# Altium schematic sheet SPSU_0.SchDoc: SPSU
size 292 x 208 mm; PCB_VERSION: V3.0; Origin: Eagle; Date: 12/02/2024 2:33:38 pm; SheetNumber: 1; SCHEMATIC_VERSION: V3.0; GateName_1: G$1; SymbolName_1: A4L-LOC; LibraryName: frames_corvus; DeviceSetName: A4L-LOC; Sheet: Sheet:
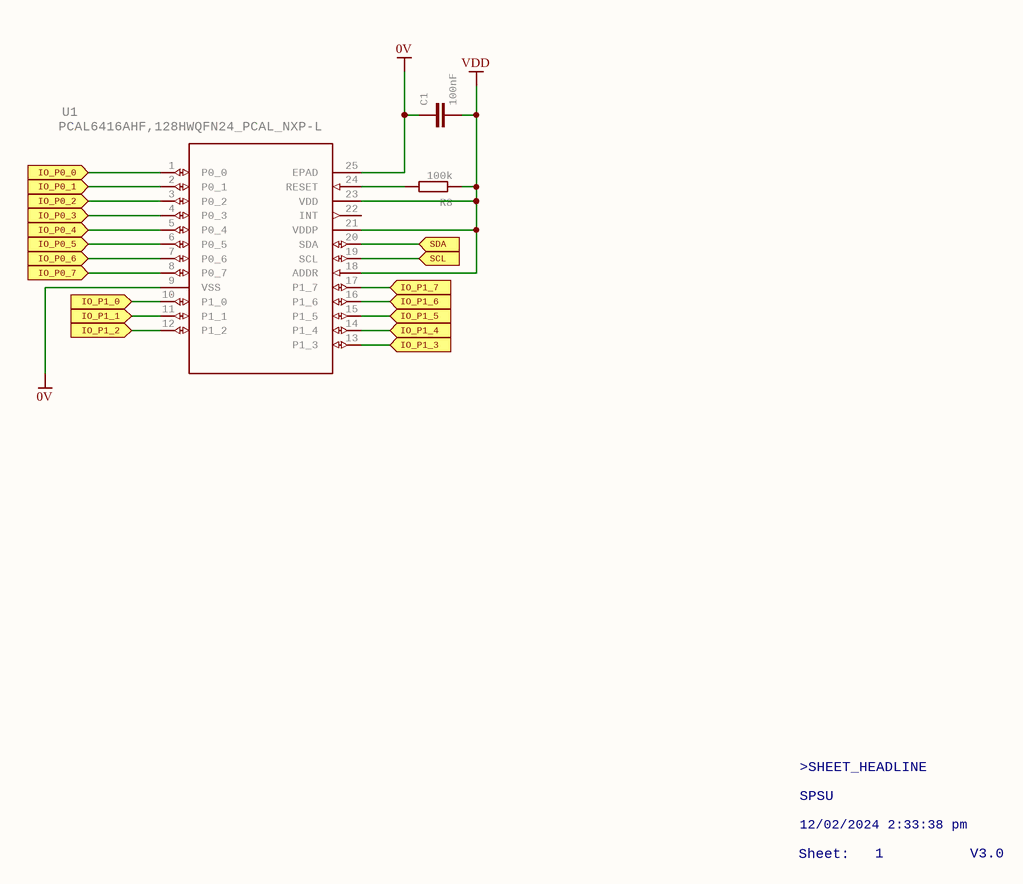
[diagram p0: SPSU_0.SchDoc]

## Parts
C1  100nF  [C0603]
R8  100k  [R0603]
U1  PCAL6416AHF,128HWQFN24_PCAL_NXP-L  [HWQFN24_PCAL_NXP-L]

## Ports
IO_P0_0 (in), IO_P0_1 (in), IO_P0_2 (in), IO_P0_3 (in), IO_P0_4 (in), IO_P0_5 (in), IO_P0_6 (in), IO_P0_7 (in), IO_P1_0 (in), IO_P1_1 (in), IO_P1_2 (in), IO_P1_3 (in), IO_P1_4 (in), IO_P1_5 (in), IO_P1_6 (in), IO_P1_7 (in), SCL (in), SDA (in)

## Nets
0V: C1.1 U1.9(VSS) U1.25(EPAD)
VDD: C1.2 R8.1 U1.18(ADDR) U1.21(VDDP) U1.23(VDD)
IO_P0_0: U1.1(P0_0) ; port IO_P0_0
IO_P0_1: U1.2(P0_1) ; port IO_P0_1
IO_P0_2: U1.3(P0_2) ; port IO_P0_2
IO_P0_3: U1.4(P0_3) ; port IO_P0_3
IO_P0_4: U1.5(P0_4) ; port IO_P0_4
IO_P0_5: U1.6(P0_5) ; port IO_P0_5
IO_P0_6: U1.7(P0_6) ; port IO_P0_6
IO_P0_7: U1.8(P0_7) ; port IO_P0_7
IO_P1_0: U1.10(P1_0) ; port IO_P1_0
IO_P1_1: U1.11(P1_1) ; port IO_P1_1
IO_P1_2: U1.12(P1_2) ; port IO_P1_2
IO_P1_3: U1.13(P1_3) ; port IO_P1_3
IO_P1_4: U1.14(P1_4) ; port IO_P1_4
IO_P1_5: U1.15(P1_5) ; port IO_P1_5
IO_P1_6: U1.16(P1_6) ; port IO_P1_6
IO_P1_7: U1.17(P1_7) ; port IO_P1_7
SCL: U1.19(SCL) ; port SCL
SDA: U1.20(SDA) ; port SDA
NetR8_2: R8.2 U1.24(RESET)

Not connected (* = marked no-connect by the designer): U1 22(INT)

## Notes on the sheet
- SPSU
- >SHEET_HEADLINE
- Sheet:
- 12/02/2024 2:33:38 pm
- 1
- V3.0

## Library data of the parts
C1 = C_0603: GateName_1: G$1; SymbolName_1: C-EU; LibraryName: corvus_RC; DeviceSetName: C_0603; FARNELL: 2320813
R8 = R_0603: GateName_1: >R_NAME$1; SymbolName_1: R-EU; LibraryName: corvus_RC; DeviceSetName: R_0603; FARNELL: 2447226
U1 = PCAL6416AHF,128HWQFN24_PCAL_NXP-L: MFR_NAME: NXP; GateName_1: A; SymbolName_1: PCAL6416AHF,128; DeviceName: HWQFN24_PCAL_NXP-L; LibraryName: PCAL6416AHF; DeviceSetName: PCAL6416AHF,128; COPYRIGHT: Copyright (C) 2022 Ultra Librarian. All rights reserved.; MANUFACTURER_PART_NUMBER: PCAL6416AHF,128